# Altium schematic sheet Connectors-Sheet.SchDoc
size 420 x 297 mm; SheetNumber: 4; SheetTotal: 4
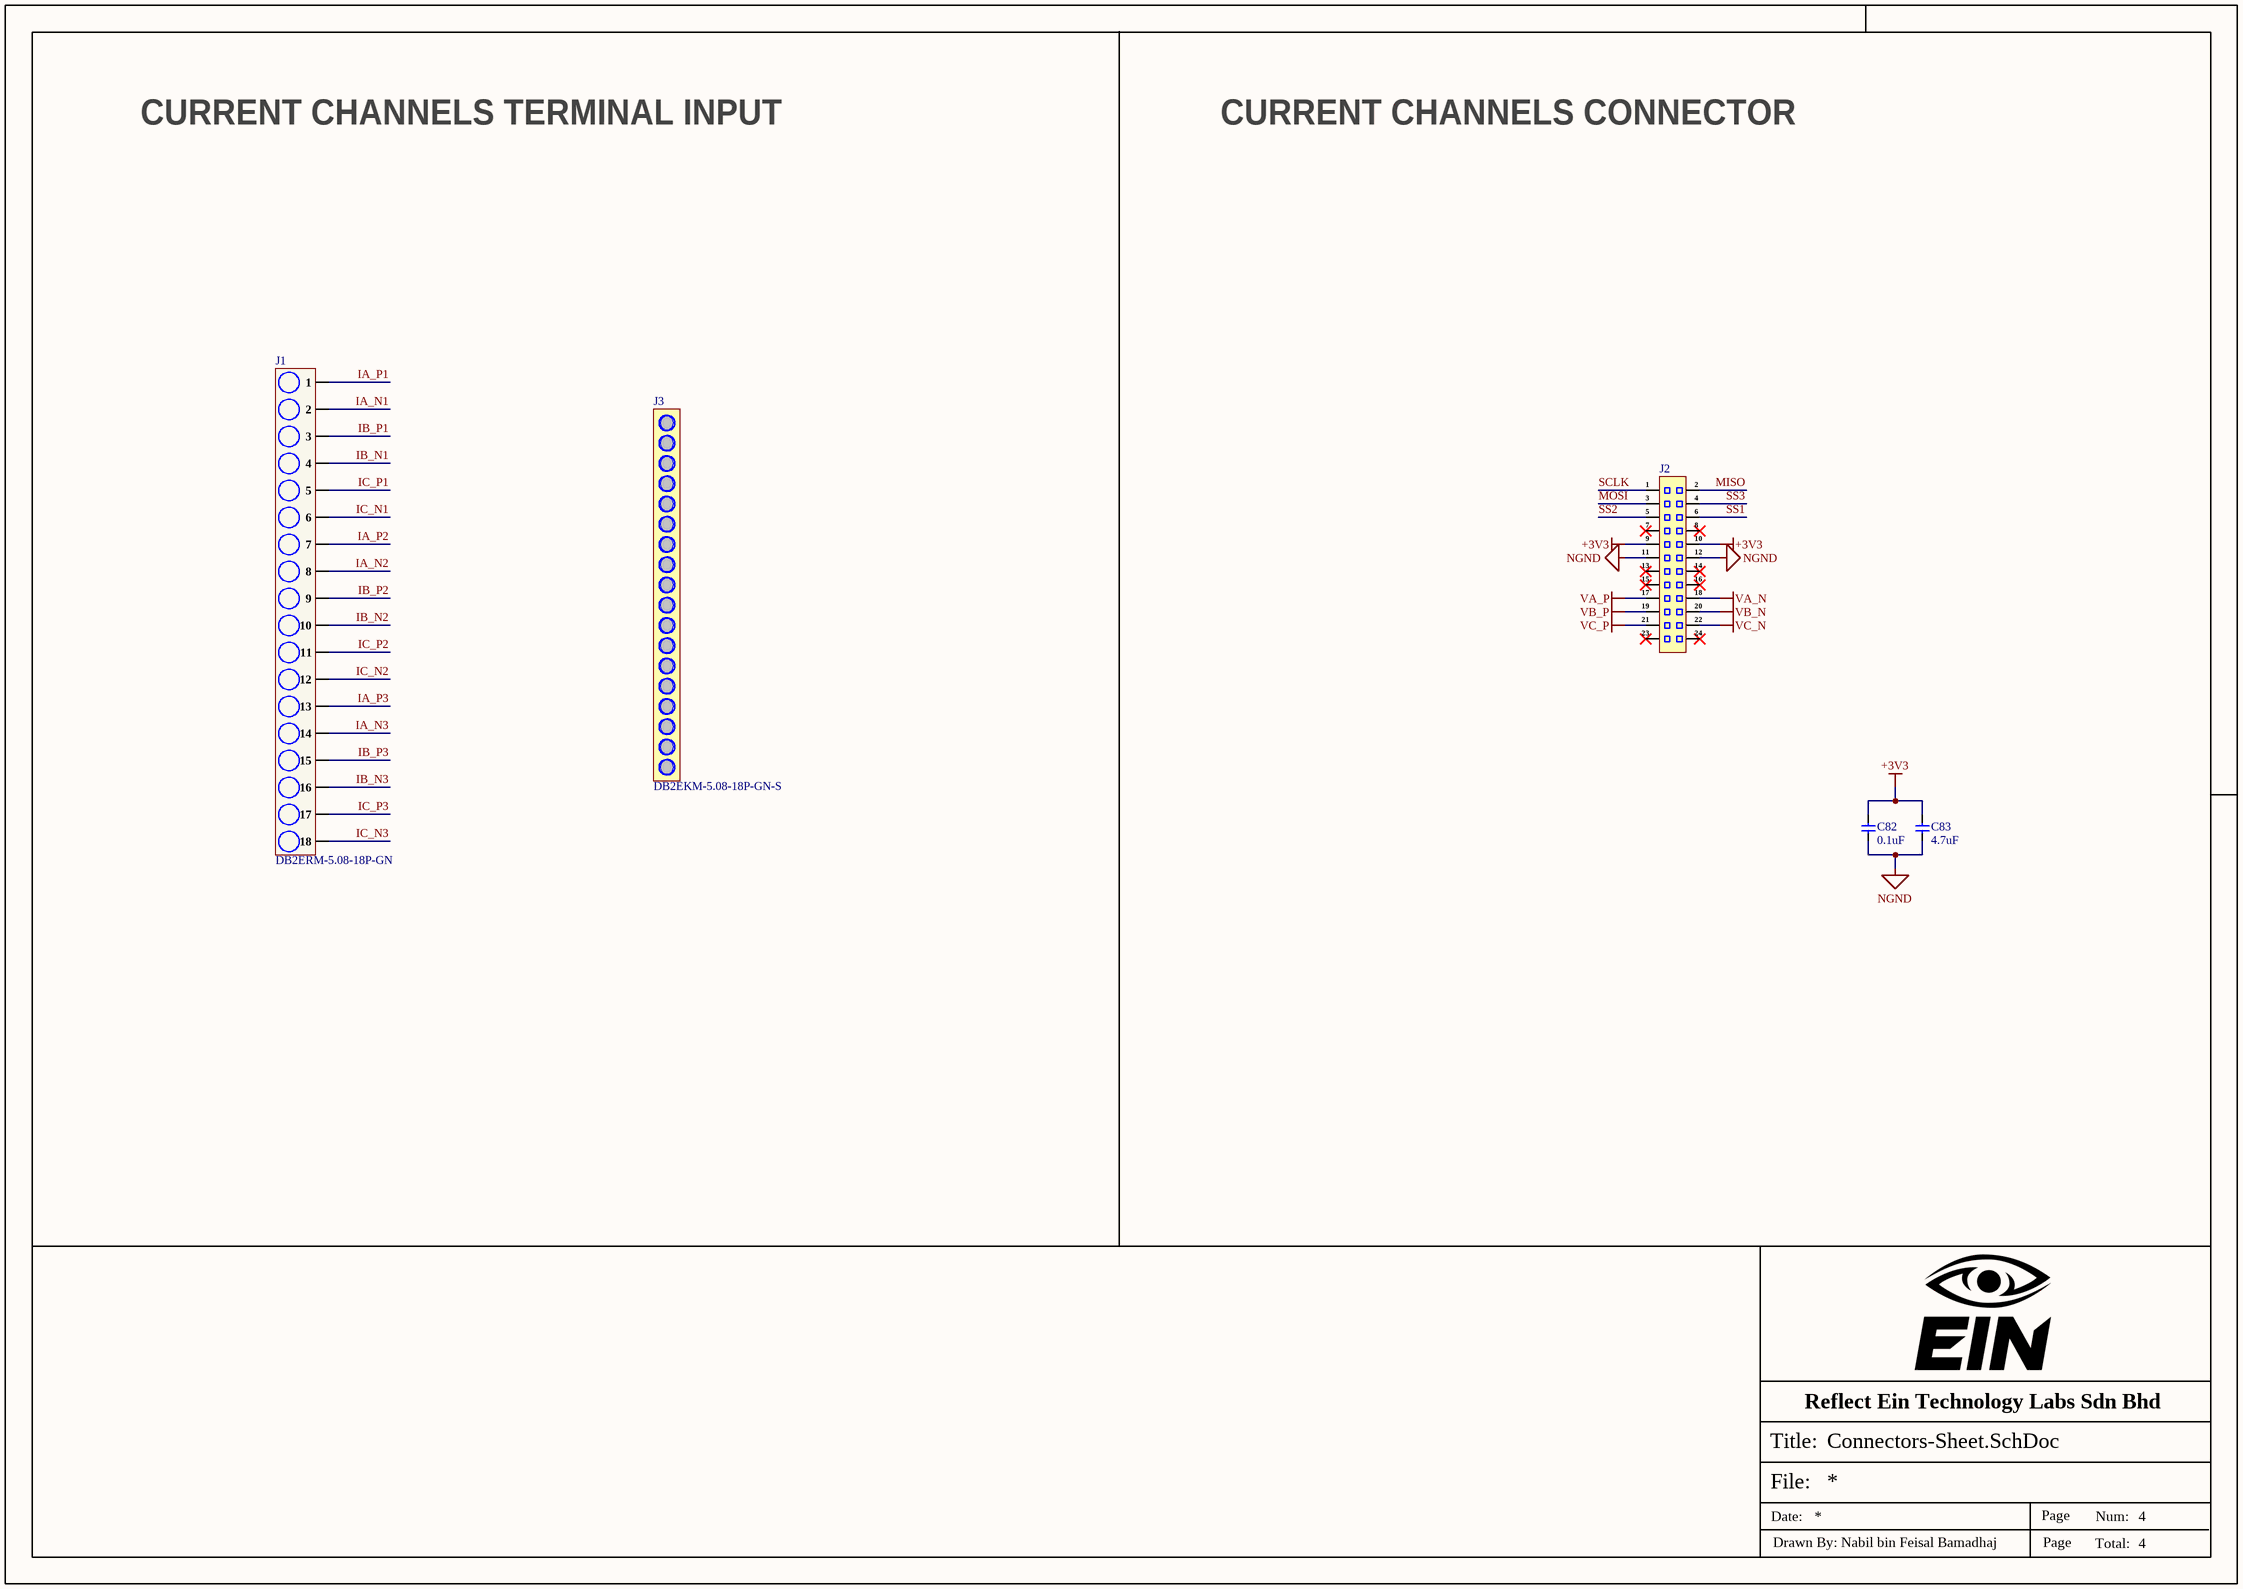
[diagram p0: Connectors-Sheet.SchDoc]

## Parts
C82  0.1uF  [Cap-0603]
C83  4.7uF  [Cap-0603]
J1  DB2ERM-5.08-18P-GN  [DB2ERM-5.08-18P-GN]
J2  SFH11-PBPC-D12-RA-BK  [SFH11-PBPC-D12-RA-BK]  (value not drawn)
J3  DB2EKM-5.08-18P-GN-S  (mechanical)

## Nets
+3V3: C82.2 C83.2 J2.9 J2.10
NGND: C82.1 C83.1 J2.11 J2.12
VA_N: J2.18
VA_P: J2.17
VB_N: J2.20
VB_P: J2.19
VC_N: J2.22
VC_P: J2.21
IA_N1: J1.2
IA_N2: J1.8
IA_N3: J1.14
IA_P1: J1.1
IA_P2: J1.7
IA_P3: J1.13
IB_N1: J1.4
IB_N2: J1.10
IB_N3: J1.16
IB_P1: J1.3
IB_P2: J1.9
IB_P3: J1.15
IC_N1: J1.6
IC_N2: J1.12
IC_N3: J1.18
IC_P1: J1.5
IC_P2: J1.11
IC_P3: J1.17
MISO: J2.2
MOSI: J2.3
SCLK: J2.1
SS1: J2.6
SS2: J2.5
SS3: J2.4

Not connected (* = marked no-connect by the designer): J2 7* 8* 13* 14* 15* 16* 23* 24*

## Notes on the sheet
- CURRENT CHANNELS TERMINAL INPUT
- CURRENT CHANNELS CONNECTOR
- Reflect Ein Technology Labs Sdn Bhd
- File:
- Title:
- Date:
- Page
- Num:
- Total:
- Drawn By: Nabil bin Feisal Bamadhaj

## Library data of the parts
C82 = GCJ188R71H104KA12D: CAP CER 0.1UF 50V X7R 0603; Manufacturer: Murata; Item Type: Capacitors; Material: 4241ConductorMaterial; Value: 100nF; Tolerance: 10%; Supplier: Mouser; LCSC Part Number: C161115; Manufacturer Part Number: GCJ188R71H104KA12D; RoHS: Yes; Stock: 342536; Pricing: 1=0.13, 10=0.056, 50=0.056, 100=0.036, 1000=0.032, 10000=0.02 (USD); Mounting Technology: Surface Mount; Case/Package: 0603; Case Code (Metric): 1608; Case Code (Imperial): 0603; Min Operating Temperature: -55°C; Max Operating Temperature: 125°C; Dielectric: X7R; Package Quantity: 1; Voltage Rating: 50V; Packaging: Tape and Reel; Voltage Rating (DC): 50V; Termination: SMD/SMT; Features: Soft Termination; Series: GCJ; Construction: Flat; Length: 1.6mm; Width: 0.031inch; Height: 0.8mm; Thickness: 0.035inch; Depth: 0.8mm; Ratings: AEC-Q200; Radiation Hardening: No; RoHS Compliant: Yes; Lead Free: 5697LeadFree; ComponentLink1URL: https://datasheet.ciiva.com/135/product-135604.pdf?src-supplier=Digikey; ComponentLink1Description: https://datasheet.ciiva.com/135/product-135604.pdf?src-supplier=Digikey; ComponentLink2URL: https://datasheet.ciiva.com/26889/getdatasheetpartid-369886-26889118.pdf?src-supplier=Verical; ComponentLink2Description: https://datasheet.ciiva.com/26889/getdatasheetpartid-369886-26889118.pdf?src-supplier=Verical; ComponentLink3URL: https://datasheet.ciiva.com/135/s0717e-135605.pdf?src-supplier=Digikey; ComponentLink3Description: https://datasheet.ciiva.com/135/s0717e-135605.pdf?src-supplier=Digikey; ComponentLink4URL: https://datasheet.ciiva.com/135/s0717e-135606.pdf?src-supplier=Digikey; ComponentLink4Description: https://datasheet.ciiva.com/135/s0717e-135606.pdf?src-supplier=Digikey; ComponentLink5URL: https://datasheet.ciiva.com/16440/c03e-16440425.pdf?src-supplier=Future+Electronics; ComponentLink5Description: https://datasheet.ciiva.com/16440/c03e-16440425.pdf?src-supplier=Future+Electronics
C83 = GRM188Z71A475KE15D: CAP CER 4.7UF 10V X7R 0603; Manufacturer: Murata; Item Type: Capacitors; Material: 4241ConductorMaterial; Tolerance: 10%; Supplier: Mouser; LCSC Part Number: C913474; Manufacturer Part Number: GRM188Z71A475KE15D; RoHS: Yes; Stock: 33218; Pricing: 1=0.24, 10=0.1, 50=0.1, 100=0.063, 1000=0.055, 10000=0.041 (USD); Case/Package: 0603; Min Operating Temperature: -55°C; Max Operating Temperature: 125°C; Value: 4.7uF; Voltage Rating: 10V; Length: 1.6mm; Width: 800um; Height: 950um; Thickness: 800um; RoHS Compliant: Yes; ComponentLink1URL: https://datasheet.octopart.com/GRM188Z71A475KE15D-Murata-datasheet-149523299.pdf?src-supplier=Newark; ComponentLink1Description: https://datasheet.octopart.com/GRM188Z71A475KE15D-Murata-datasheet-149523299.pdf?src-supplier=Newark; ComponentLink2URL: https://datasheet.octopart.com/GRM188Z71A475KE15D-Murata-datasheet-165579666.pdf?src-supplier=TME; ComponentLink2Description: https://datasheet.octopart.com/GRM188Z71A475KE15D-Murata-datasheet-165579666.pdf?src-supplier=TME
J1 = DB2ERM-5.08-18P-GN: 320V 20A 18 Bend -40℃~+105℃ 1 5.08mm 1x18P Green Receptacle-Close Screw Fixing Push-Pull,P=5.08mm Pluggable System Terminal Block ROHS; Manufacturer: DORABO; Manufacturer Part Number: DB2ERM-5.08-18P-GN; Package: Push-Pull,P=5.08mm; LCSC Part Number: C430542; Item Type: Terminal Block; ComponentLink1Description: LCSC; ComponentLink1URL: https://www.lcsc.com/product-detail/Pluggable-System-Terminal-Block_DORABO-DB2ERM-5-08-18P-GN_C430542.html?s_z=n_DB2ERM-5.08-18P-GN
J2 = SFH11-PBPC-D12-RA-BK: CONN HDR 24POS 0.1 GOLD PCB R/A; Manufacturer: Sullins; Item Type: Connectors; Number of Positions: 24; Connector Type: Header; Pitch: 0.1inch; Supplier: Digikey; Manufacturer Part Number: SFH11-PBPC-D12-RA-BK; RoHS: Yes; Pricing: 1000=0.8853 (USD); Mounting Technology: Through Hole; Color: Black; Contact Plating: Gold; Package Quantity: 1000; Packaging: Tray; Number of Rows: 2; Termination: Solder; Series: SFH11; Contact Type: Female Socket; Row Spacing: 0.1inch; RoHS Compliant: Yes; ComponentLink1URL: http://sullinscorp.com/catalogs/147_PAGE119_.100_SFH11_SERIES_FEMALE_HDR_ST_RA.pdf?src-supplier=Digikey; ComponentLink1Description: http://sullinscorp.com/catalogs/147_PAGE119_.100_SFH11_SERIES_FEMALE_HDR_ST_RA.pdf?src-supplier=Digikey
J3 = DB2EKM-5.08-18P-GN-S: -40℃~+105℃ 2.5 1 14~28 5.08mm 320V 20A 18 1x18P Green Plug Screw Fixing P=5.08mm Pluggable System Terminal Block ROHS; Manufacturer: DORABO; Manufacturer Part Number: DB2EKM-5.08-18P-GN-S; Package: P=5.08mm; LCSC Part Number: C430525; Item Type: Terminal Block; ComponentLink1Description: LCSC; ComponentLink1URL: https://www.lcsc.com/product-detail/Pluggable-System-Terminal-Block_DORABO-DB2EKM-5-08-18P-GN-S_C430525.html?s_z=n_DB2EKM-5.08-18P-GN-S